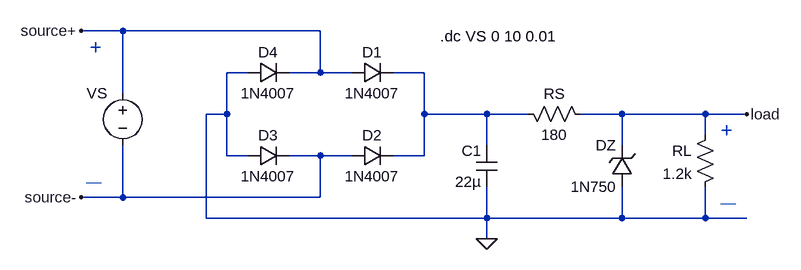
[diagram p0: schematic zener_diode_regulator.asc]
zener_diode_regulator.asc, the LTspice schematic file:
Version 4.1
SHEET 1 1216 680
WIRE 128 160 64 160
WIRE 432 160 128 160
WIRE 320 224 288 224
WIRE 432 224 432 160
WIRE 432 224 384 224
WIRE 480 224 432 224
WIRE 592 224 544 224
WIRE 128 256 128 160
WIRE 288 288 288 224
WIRE 288 288 256 288
WIRE 592 288 592 224
WIRE 688 288 592 288
WIRE 752 288 688 288
WIRE 896 288 832 288
WIRE 1024 288 896 288
WIRE 1088 288 1024 288
WIRE 1024 320 1024 288
WIRE 688 336 688 288
WIRE 896 336 896 288
WIRE 288 352 288 288
WIRE 320 352 288 352
WIRE 432 352 384 352
WIRE 480 352 432 352
WIRE 592 352 592 288
WIRE 592 352 544 352
WIRE 128 416 128 336
WIRE 128 416 64 416
WIRE 432 416 432 352
WIRE 432 416 128 416
WIRE 256 448 256 288
WIRE 688 448 688 400
WIRE 688 448 256 448
WIRE 896 448 896 400
WIRE 896 448 688 448
WIRE 1024 448 1024 400
WIRE 1024 448 896 448
WIRE 1088 448 1024 448
WIRE 688 480 688 448
FLAG 688 480 0
FLAG 1088 288 load
FLAG 64 160 source+
FLAG 64 416 source-
SYMBOL voltage 128 240 M0
WINDOW 123 0 0 Left 0
WINDOW 39 0 0 Left 0
SYMATTR InstName VS
SYMATTR Value ""
SYMBOL diode 480 240 R270
WINDOW 0 32 32 VTop 2
WINDOW 3 0 32 VBottom 2
SYMATTR InstName D1
SYMATTR Value 1N4007
SYMBOL diode 480 368 R270
WINDOW 0 32 32 VTop 2
WINDOW 3 0 32 VBottom 2
SYMATTR InstName D2
SYMATTR Value 1N4007
SYMBOL diode 320 368 R270
WINDOW 0 32 32 VTop 2
WINDOW 3 0 32 VBottom 2
SYMATTR InstName D3
SYMATTR Value 1N4007
SYMBOL diode 320 240 R270
WINDOW 0 32 32 VTop 2
WINDOW 3 0 32 VBottom 2
SYMATTR InstName D4
SYMATTR Value 1N4007
SYMBOL cap 704 336 M0
SYMATTR InstName C1
SYMATTR Value 22µ
SYMBOL res 1040 304 M0
SYMATTR InstName RL
SYMATTR Value 1.2k
SYMBOL res 736 272 M90
WINDOW 0 0 56 VBottom 2
WINDOW 3 32 56 VTop 2
SYMATTR InstName RS
SYMATTR Value 180
SYMBOL zener 912 400 R180
WINDOW 0 24 64 Left 2
WINDOW 3 24 0 Left 2
SYMATTR InstName DZ
SYMATTR Value 1N750
TEXT 1048 312 Left 3 ;+
TEXT 1048 424 Left 2 ;—
TEXT 96 184 Right 3 ;+
TEXT 96 392 Right 2 ;—
TEXT 616 168 Left 2 !.dc VS 0 10 0.01

The netlist it stands for:
* zener_diode_regulator.asc
VS source+ source-
D1 source+ N001 1N4007
D2 source- N001 1N4007
D3 0 source- 1N4007
D4 0 source+ 1N4007
C1 N001 0 22µ
RL load 0 1.2k
RS N001 load 180
DZ 0 load 1N750
.model D D
.lib standard.dio
* +
* —
* +
* —
.dc VS 0 10 0.01
.backanno
.end